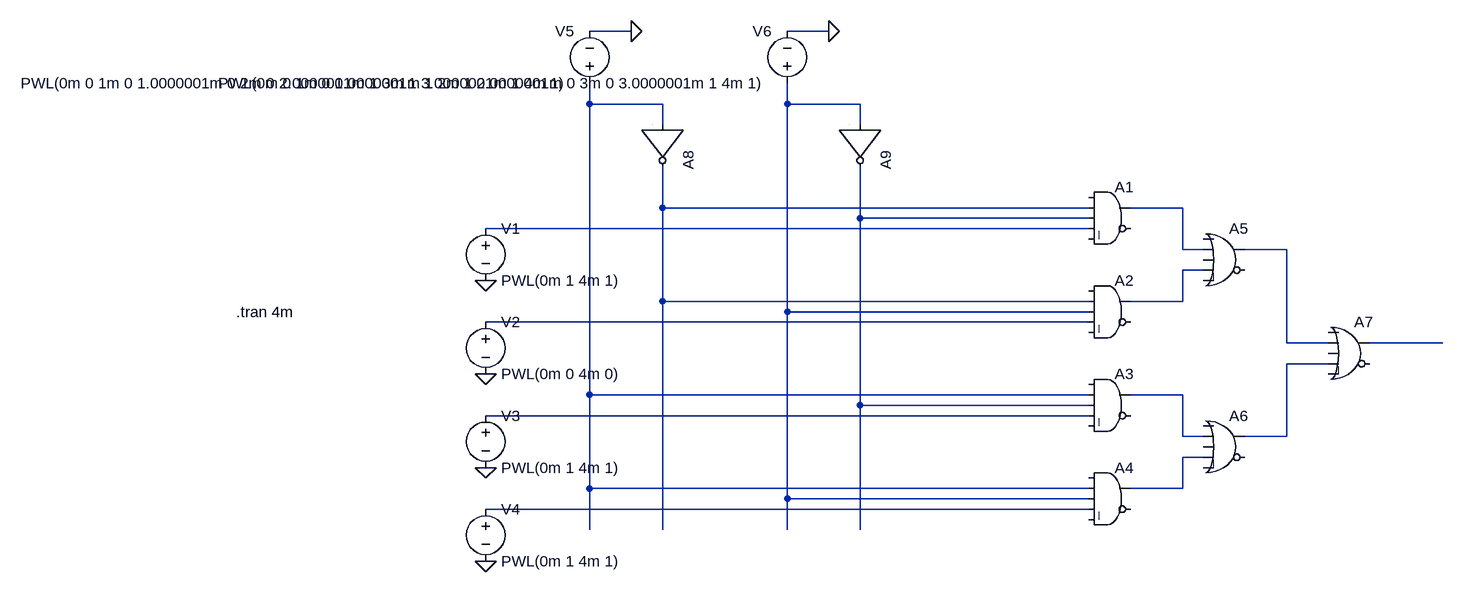
[diagram p0: schematic mux1.asc]
mux1.asc, the LTspice schematic file:
Version 4.1
SHEET 1 880 752
WIRE -528 -96 -592 -96
WIRE -224 -96 -288 -96
WIRE -592 16 -592 -16
WIRE -480 16 -592 16
WIRE -288 16 -288 -16
WIRE -176 16 -288 16
WIRE -480 48 -480 16
WIRE -176 48 -176 16
WIRE -480 176 -480 112
WIRE 176 176 -480 176
WIRE 320 176 240 176
WIRE -176 192 -176 112
WIRE 176 192 -176 192
WIRE 176 208 -752 208
WIRE 320 240 320 176
WIRE 352 240 320 240
WIRE 480 240 416 240
WIRE 352 272 320 272
WIRE -480 320 -480 176
WIRE 176 320 -480 320
WIRE 320 320 320 272
WIRE 320 320 240 320
WIRE -288 336 -288 16
WIRE 176 336 -288 336
WIRE 176 352 -752 352
WIRE 480 384 480 240
WIRE 544 384 480 384
WIRE 720 384 608 384
WIRE 544 416 480 416
WIRE -592 464 -592 16
WIRE 176 464 -592 464
WIRE 320 464 240 464
WIRE -176 480 -176 192
WIRE 176 480 -176 480
WIRE 176 496 -752 496
WIRE 320 528 320 464
WIRE 352 528 320 528
WIRE 480 528 480 416
WIRE 480 528 416 528
WIRE 352 560 320 560
WIRE -592 608 -592 464
WIRE 176 608 -592 608
WIRE 320 608 320 560
WIRE 320 608 240 608
WIRE -288 624 -288 336
WIRE 176 624 -288 624
WIRE 176 640 -752 640
WIRE -592 672 -592 608
WIRE -480 672 -480 320
WIRE -288 672 -288 624
WIRE -176 672 -176 480
FLAG -752 288 0
FLAG -752 432 0
FLAG -752 576 0
FLAG -752 720 0
FLAG -528 -96 0
FLAG -224 -96 0
SYMBOL Digital\\and 208 128 R0
SYMATTR InstName A1
SYMBOL Digital\\and 208 272 R0
SYMATTR InstName A2
SYMBOL Digital\\and 208 416 R0
SYMATTR InstName A3
SYMBOL Digital\\and 208 560 R0
SYMATTR InstName A4
SYMBOL Digital\\or 384 192 R0
SYMATTR InstName A5
SYMBOL Digital\\or 384 480 R0
SYMATTR InstName A6
SYMBOL Digital\\or 576 336 R0
SYMATTR InstName A7
SYMBOL Digital\\inv -416 48 R90
SYMATTR InstName A8
SYMBOL Digital\\inv -112 48 R90
SYMATTR InstName A9
SYMBOL voltage -752 192 R0
WINDOW 123 0 0 Left 0
WINDOW 39 0 0 Left 0
SYMATTR InstName V1
SYMATTR Value PWL(0m 1 4m 1)
SYMBOL voltage -752 336 R0
WINDOW 123 0 0 Left 0
WINDOW 39 0 0 Left 0
SYMATTR InstName V2
SYMATTR Value PWL(0m 0 4m 0)
SYMBOL voltage -752 480 R0
WINDOW 123 0 0 Left 0
WINDOW 39 0 0 Left 0
SYMATTR InstName V3
SYMATTR Value PWL(0m 1 4m 1)
SYMBOL voltage -752 624 R0
WINDOW 123 0 0 Left 0
WINDOW 39 0 0 Left 0
SYMATTR InstName V4
SYMATTR Value PWL(0m 1 4m 1)
SYMBOL voltage -592 0 R180
WINDOW 0 24 96 Left 2
WINDOW 3 24 16 Left 2
WINDOW 123 0 0 Left 0
WINDOW 39 0 0 Left 0
SYMATTR InstName V5
SYMATTR Value PWL(0m 0 1m 0 1.0000001m 0 2m 0 2.0000001m 1 3m 1 3.0000001m 1 4m 1)
SYMBOL voltage -288 0 R180
WINDOW 0 24 96 Left 2
WINDOW 3 24 16 Left 2
WINDOW 123 0 0 Left 0
WINDOW 39 0 0 Left 0
SYMATTR InstName V6
SYMATTR Value PWL(0m 0 1m 0 1.0000001m 1 2m 1 2.0000001m 0 3m 0 3.0000001m 1 4m 1)
TEXT -1136 336 Left 2 !.tran 4m

The netlist it stands for:
* mux1.asc
A1 0 N003 N005 N006 0 0 N004 0 AND
A2 0 N003 N002 N009 0 0 N008 0 AND
A3 0 N001 N005 N013 0 0 N012 0 AND
A4 0 N001 N002 N015 0 0 N014 0 AND
A5 0 N004 0 N008 0 0 N007 0 OR
A6 0 N012 0 N014 0 0 N011 0 OR
A7 0 N007 0 N011 0 0 N010 0 OR
A8 N001 0 0 0 0 N003 0 0 BUF
A9 N002 0 0 0 0 N005 0 0 BUF
V1 N006 0 PWL(0m 1 4m 1)
V2 N009 0 PWL(0m 0 4m 0)
V3 N013 0 PWL(0m 1 4m 1)
V4 N015 0 PWL(0m 1 4m 1)
V5 N001 0 PWL(0m 0 1m 0 1.0000001m 0 2m 0 2.0000001m 1 3m 1 3.0000001m 1 4m 1)
V6 N002 0 PWL(0m 0 1m 0 1.0000001m 1 2m 1 2.0000001m 0 3m 0 3.0000001m 1 4m 1)
.tran 4m
.backanno
.end